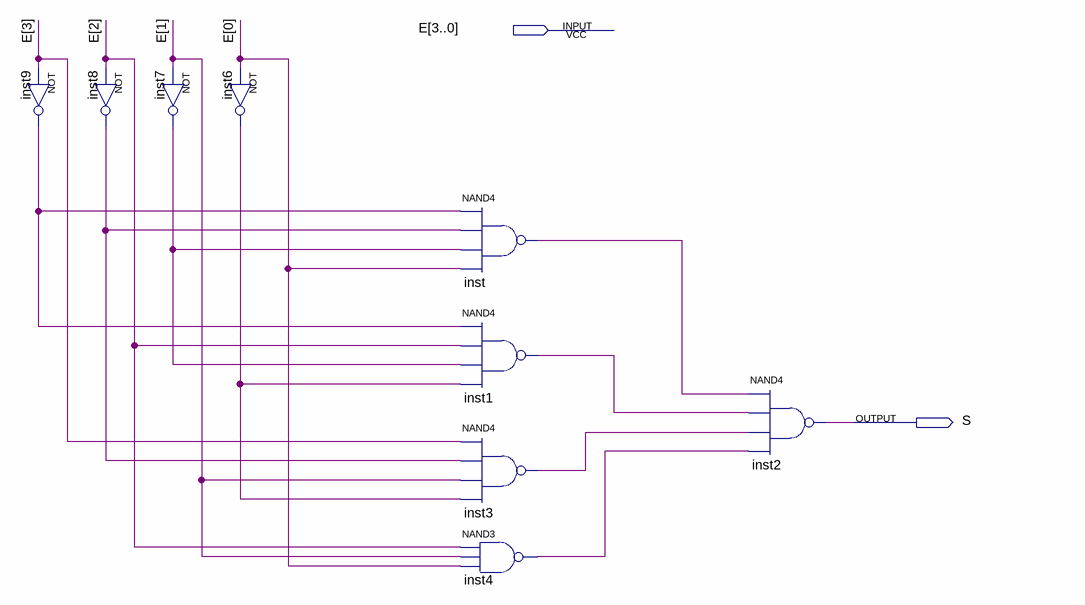
[diagram p0: schematic sheet]
// Quartus schematic S_D.bdf as structural Verilog: 9 symbols, 2 pins
module S_D (
  input  [3:0] E,
  output S
);

  wire inst1_out, inst3_out, inst4_out, inst6_out, inst7_out, inst8_out, inst9_out, inst_out;

  not inst9 (inst9_out, E[3]);
  not inst7 (inst7_out, E[1]);
  not inst8 (inst8_out, E[2]);
  not inst6 (inst6_out, E[0]);
  nand inst (inst_out, inst9_out, inst8_out, inst7_out, E[0]);
  nand inst1 (inst1_out, inst9_out, E[2], inst7_out, inst6_out);
  nand inst3 (inst3_out, E[3], inst8_out, E[1], inst6_out);
  nand inst4 (inst4_out, E[2], E[1], E[0]);
  nand inst2 (S, inst_out, inst1_out, inst3_out, inst4_out);
endmodule
